# Altium schematic sheet Peripherals-Sheet-1.SchDoc (part 1 of 3)
size 420 x 297 mm; SheetNumber: 9; SheetTotal: 12
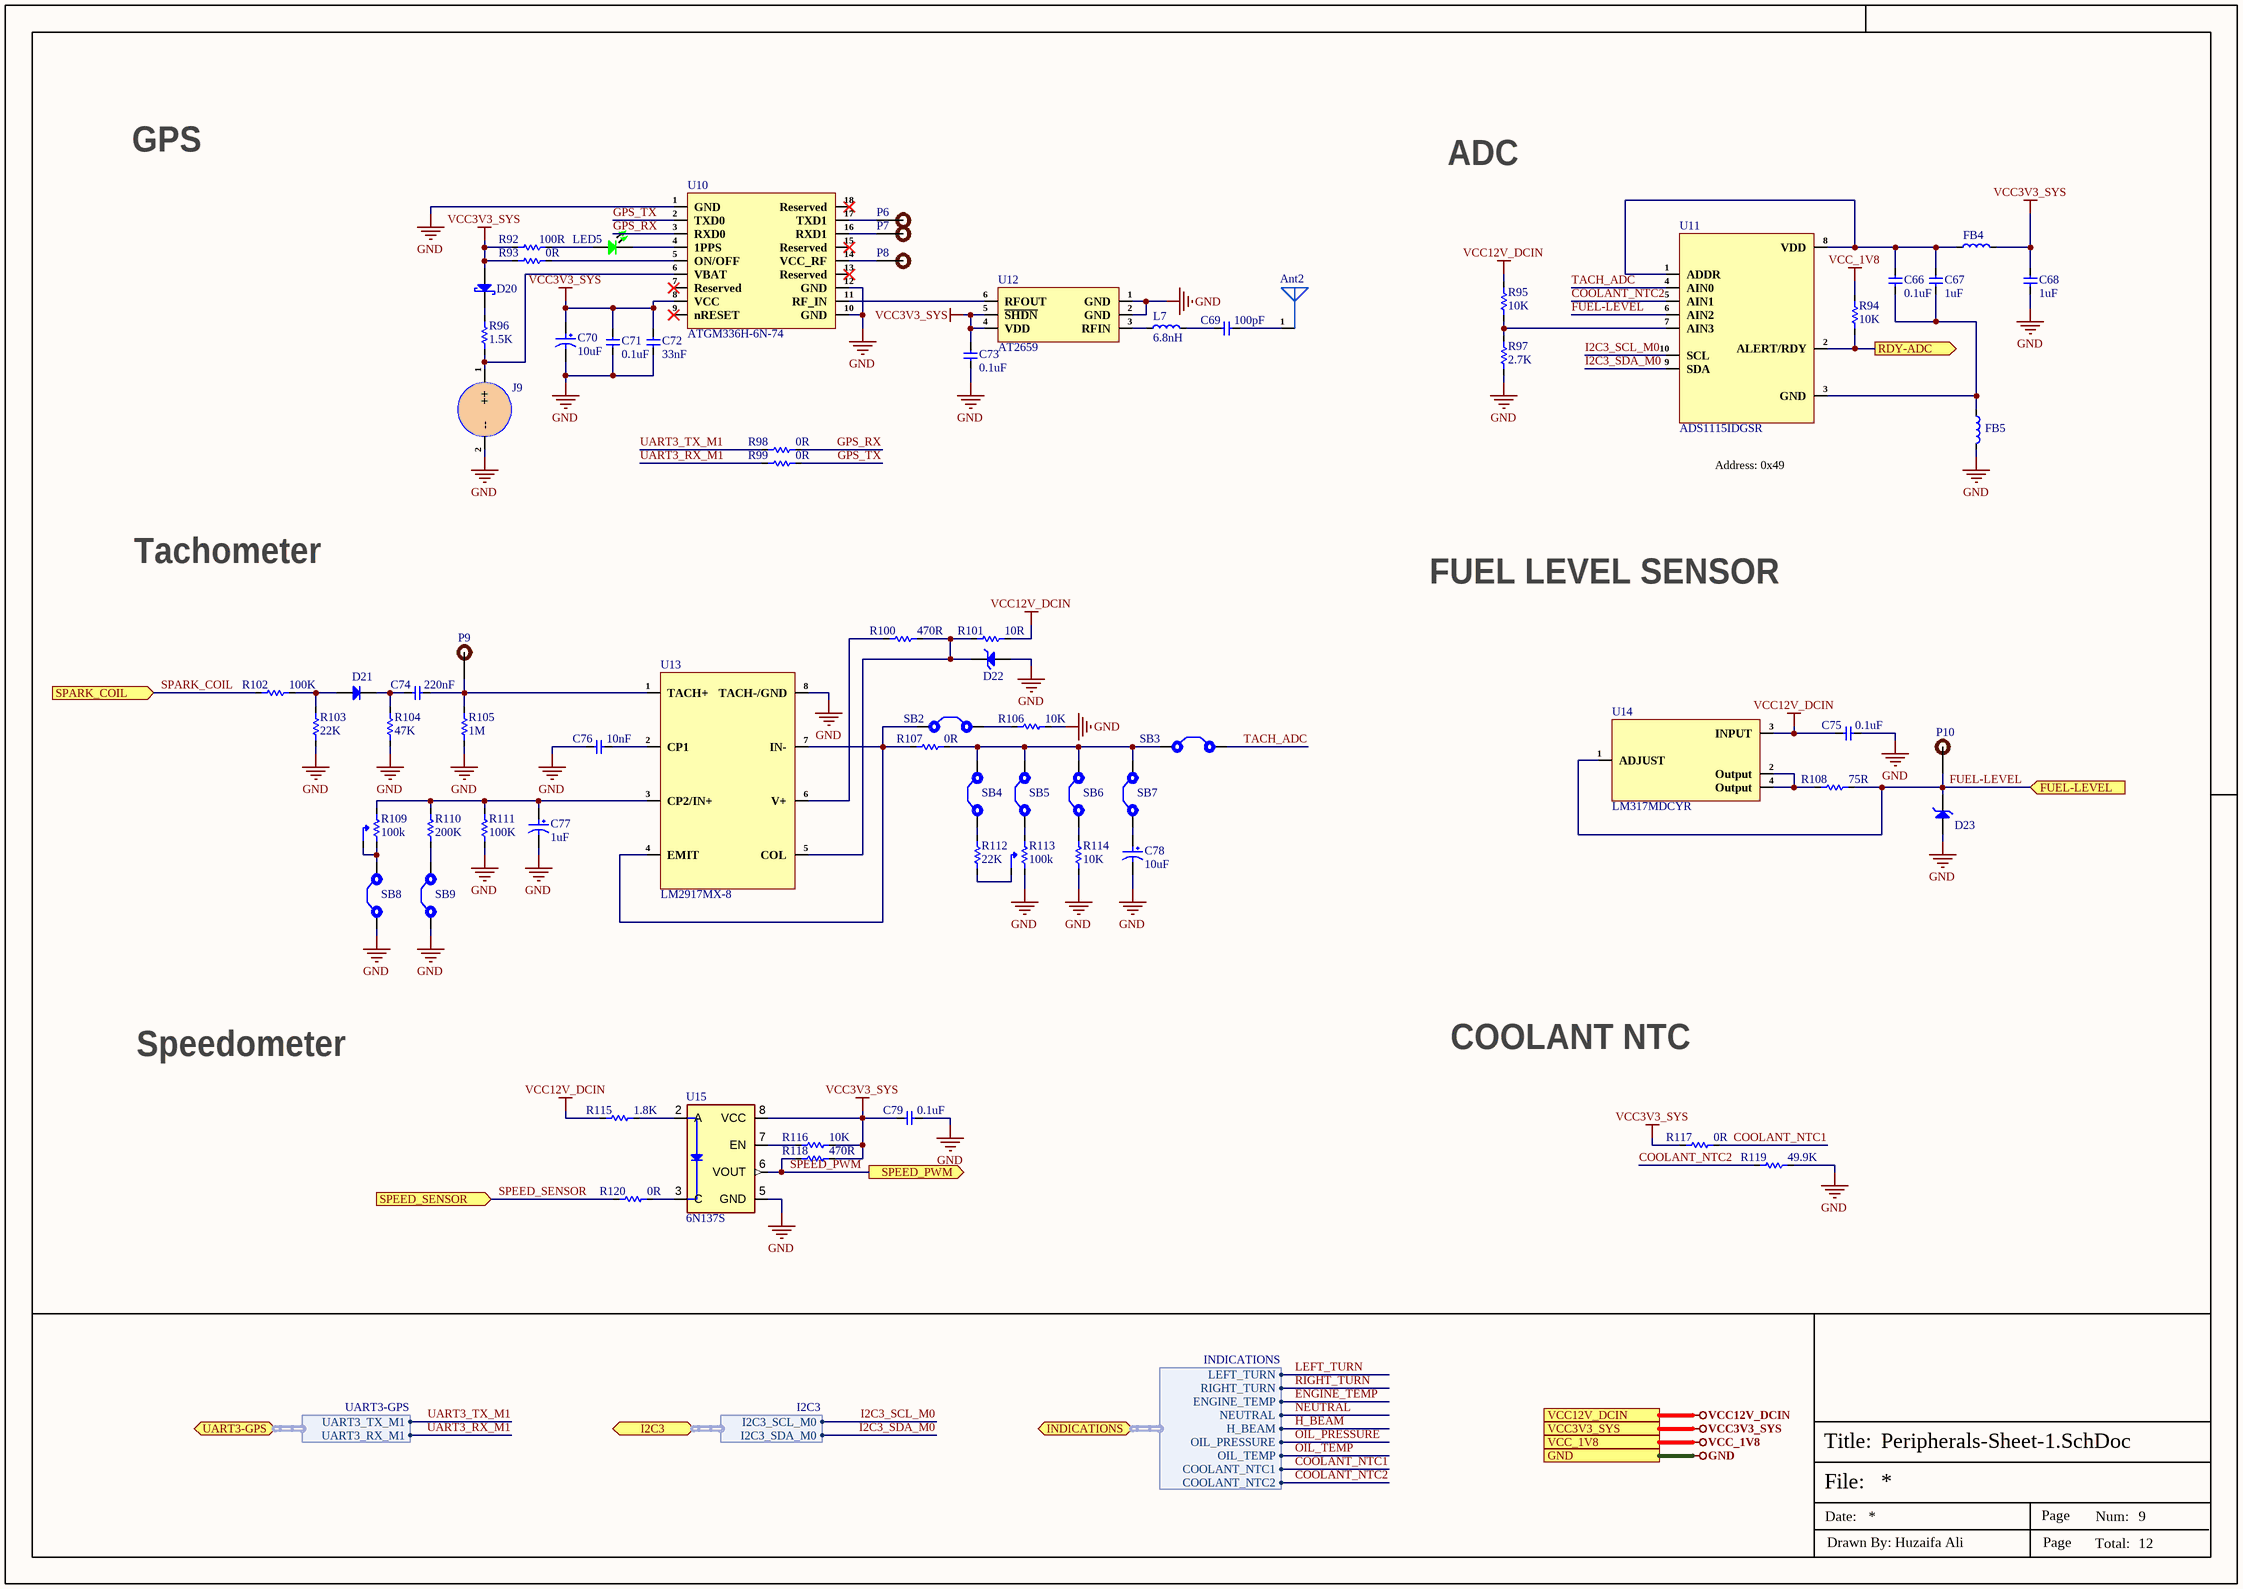
[diagram p0: Peripherals-Sheet-1.SchDoc]

## Parts
Ant2  KH-GPS181804-WY  [KH-GPS181804-WY]  (value not drawn)
C66  0.1uF  [Cap-0402]
C67  1uF  [Cap-0402]
C68  1uF  [Cap-0402]
C69  100pF  [Cap-0603]
C70  10uF  [RVT1E100M0405_]
C71  0.1uF  [Cap-0402]
C72  33nF  [Cap-0402]
C73  0.1uF  [Cap-0402]
C74  220nF  [Cap-1210]
C75  0.1uF  [Cap-0402]
C76  10nF  [Cap-0805]
C77  1uF  [RVT1H1R0M0405]
C78  10uF  [50SVPF10M]
C79  0.1uF  [Cap-0402]
D20  B5819WS  [SOD-323]  (value not drawn)
D21  1N4007- SMD  [SMA(DO-214AC)]  (value not drawn)
D22  BZT52C16  [SOD-123]  (value not drawn)
D23  MSP3V3HM3/89A  [MicroSMP]  (value not drawn)
FB4  MMZ2012R102ATD25  [Ind-0805]  (value not drawn)
FB5  MMZ2012R102ATD25  [Ind-0805]  (value not drawn)
J9  PB-621SR13-TF  [PB-621SR13-TF]  (value not drawn)
L7  6.8nH  [Ind-0805]
LED5  Emerald  [LED-0603]  (value not drawn)
P6  TEST POINT 0.5mm Dia  [Test-point - 0.5mm]  (value not drawn)  (no BOM)
P7  TEST POINT 0.5mm Dia  [Test-point - 0.5mm]  (value not drawn)  (no BOM)
P8  TEST POINT 0.5mm Dia  [Test-point - 0.5mm]  (value not drawn)  (no BOM)
P9  TEST POINT 0.5mm Dia  [Test-point - 0.5mm]  (value not drawn)  (no BOM)
P10  TEST POINT 0.5mm Dia  [Test-point - 0.5mm]  (value not drawn)  (no BOM)
R92  100R  [Res-0402]
R93  0R  [Res-0402]
R94  10K  [Res-0402]
R95  10K  [Res-0603]
R96  1.5K  [Res-0402]
R97  2.7K  [Res-0603]
R98  0R  [Res-0402]
R99  0R  [Res-0402]
R100  470R  [Res-0603]
R101  10R  [Res-0603]
R102  100K  [RES-0805]
R103  22K  [Res-0603]
R104  47K  [Res-0603]
R105  1M  [RES-0805]
R106  10K  [Res-0402]
R107  0R  [Res-0805]
R108  75R  [Res-0603]
R109  100k  [TC33X-2-104E_]
R110  200K  [Res-0402]
R111  100K  [Res-0402]
R112  22K  [Res-0603]
R113  100k  [TC33X-2-104E_]
R114  10K  [Res-0402]
R115  1.8K  [Res-0402]
R116  10K  [Res-0402]
R117  0R  [Res-0402]
R118  470R  [Res-0402]
R119  49.9K  [Res-0402]
R120  0R  [Res-0402]
SB2  Solder Bridge 0603  [Solder Bridge]  (value not drawn)  (no BOM)
SB3  Solder Bridge 0603  [Solder Bridge]  (value not drawn)  (no BOM)
SB4  Solder Bridge 0603  [Solder Bridge]  (value not drawn)  (no BOM)
SB5  Solder Bridge 0603  [Solder Bridge]  (value not drawn)  (no BOM)
SB6  Solder Bridge 0603  [Solder Bridge]  (value not drawn)  (no BOM)
SB7  Solder Bridge 0603  [Solder Bridge]  (value not drawn)  (no BOM)
SB8  Solder Bridge 0603  [Solder Bridge]  (value not drawn)  (no BOM)
SB9  Solder Bridge 0603  [Solder Bridge]  (value not drawn)  (no BOM)
U10  ATGM336H-6N-74  [ATGM336H-6N-74]
U11  ADS1115IDGSR  [VSSOP-10]
U12  AT2659  [DFN-6(1x1.6)]
U13  LM2917MX-8  [SOIC-8(0.154", 3.90mm Width)]
U14  LM317MDCYR  [SOT- 223]
U15  6N137S  [8-SMD]

## Ports
FUEL-LEVEL (in, see Top-Sheet[4B]), GND (see Top-Sheet[6B]), I2C3 (bidir, harness I2C3, see Top-Sheet[4B]), INDICATIONS (bidir, harness INDICATIONS, see Top-Sheet[4B]), RDY-ADC (out, see Top-Sheet[4B]), SPARK_COIL (in, see Top-Sheet[4B]), SPEED_PWM (out, see Top-Sheet[4B]), SPEED_SENSOR (in, see Top-Sheet[4B]), UART3-GPS (bidir, harness UART3-GPS, see Top-Sheet[4B]), VCC3V3_SYS (see Top-Sheet[6B]), VCC12V_DCIN (see Top-Sheet[6B]), VCC_1V8 (see Top-Sheet[6B])

## Harnesses
UART3-GPS: UART3_TX_M1, UART3_RX_M1
I2C3: I2C3_SCL_M0, I2C3_SDA_M0
INDICATIONS: LEFT_TURN, RIGHT_TURN, ENGINE_TEMP, NEUTRAL, H_BEAM, OIL_PRESSURE, OIL_TEMP, COOLANT_NTC1, COOLANT_NTC2

## Nets
GND: C68.2 C70.2 C71.1 C72.1 C73.1 C75.1 C76.1 C77.2 C78.2 C79.2 D22.1(A) D23.1(A) FB5.2 J9.2(--) R97.1 R103.1 R104.1 R105.1 R106.2 R111.1 R113.1(CCW) R114.1 R119.2 SB8.1 SB9.1 U10.1(GND) U10.10(GND) U10.12(GND) U12.1(GND) U12.2(GND) U13.8(TACH-/GND) U15.5(GND) ; port GND
VCC3V3_SYS: C68.1 C70.1 C71.2 C72.2 C73.2 C79.1 D20.2(A) FB4.2 R92.1 R93.1 R116.2 R117.1 R118.2 U10.8(VCC) U12.4(VDD) U12.5(~{SH}~{DN}) U15.8(VCC) ; port VCC3V3_SYS
VCC12V_DCIN: C75.2 R95.2 R101.2 R115.1 U14.3(INPUT) ; port VCC12V_DCIN
VCC_1V8: R94.2 ; port VCC_1V8
COOLANT_NTC1: R117.2 ; port INDICATIONS.COOLANT_NTC1
COOLANT_NTC2: R119.1 U11.5(AIN1) ; port INDICATIONS.COOLANT_NTC2
ENGINE_TEMP: port INDICATIONS.ENGINE_TEMP
FUEL-LEVEL: D23.2(K) P10.1 R108.2 U11.6(AIN2) U14.1(ADJUST) ; port FUEL-LEVEL
GPS_RX: R98.2 U10.3(RXD0)
GPS_TX: R99.2 U10.2(TXD0)
H_BEAM: port INDICATIONS.H_BEAM
I2C3_SCL_M0: U11.10(SCL) ; port I2C3.I2C3_SCL_M0
I2C3_SDA_M0: U11.9(SDA) ; port I2C3.I2C3_SDA_M0
LEFT_TURN: port INDICATIONS.LEFT_TURN
NEUTRAL: port INDICATIONS.NEUTRAL
OIL_PRESSURE: port INDICATIONS.OIL_PRESSURE
OIL_TEMP: port INDICATIONS.OIL_TEMP
RDY-ADC: R94.1 U11.2(ALERT/RDY) ; port RDY-ADC
RIGHT_TURN: port INDICATIONS.RIGHT_TURN
SPARK_COIL: R102.1 ; port SPARK_COIL
SPEED_PWM: R118.1 U15.6(VOUT) ; port SPEED_PWM
SPEED_SENSOR: R120.1 ; port SPEED_SENSOR
TACH_ADC: SB3.2 U11.4(AIN0)
UART3_RX_M1: R99.1 ; port UART3-GPS.UART3_RX_M1
UART3_TX_M1: R98.1 ; port UART3-GPS.UART3_TX_M1
NetAnt2_1: Ant2.1 C69.2
NetC66_1: C66.1 C67.1 FB4.1 U11.1(ADDR) U11.8(VDD)
NetC66_2: C66.2 C67.2 FB5.1 U11.3(GND)
NetC69_1: C69.1 L7.2
NetC74_1: C74.1 P9.1 R105.2 U13.1(TACH+)
NetC74_2: C74.2 D21.1(K) R104.2
NetC76_2: C76.2 U13.2(CP1)
NetC77_1: C77.1 R109.3(CW) R110.2 R111.2 U13.3(CP2/IN+)
NetC78_1: C78.1 SB7.1
NetD20_1: D20.1(K) R96.2
NetD21_2: D21.2(A) R102.2 R103.2
NetD22_2: D22.2(K) R100.2 R101.1 U13.5(COL)
NetJ9_1: J9.1(++) R96.1 U10.6(VBAT)
NetL7_1: L7.1 U12.3(RFIN)
NetLED5_1: LED5.1 R92.2
NetLED5_2: LED5.2 U10.4(1PPS)
NetP6_1: P6.1 U10.17(TXD1)
NetP7_1: P7.1 U10.16(RXD1)
NetP8_1: P8.1 U10.14(VCC_RF)
NetR93_2: R93.2 U10.5(ON/OFF)
NetR95_1: R95.1 R97.2 U11.7(AIN3)
NetR100_1: R100.1 U13.6(V+)
NetR106_1: R106.1 SB2.2
NetR107_1: R107.1 SB2.1 U13.4(EMIT) U13.7(IN-)
NetR107_2: R107.2 SB3.1 SB4.2 SB5.2 SB6.2 SB7.2
NetR108_1: R108.1 U14.2(Output) U14.4(Output)
NetR109_1: R109.1(CCW) R109.2(Wiper) SB8.2
NetR110_1: R110.1 SB9.2
NetR112_1: R112.1 R113.2(Wiper)
NetR112_2: R112.2 SB4.1
NetR113_3: R113.3(CW) SB5.1
NetR114_2: R114.2 SB6.1
NetR115_2: R115.2 U15.2(A)
NetR116_1: R116.1 U15.7(EN)
NetR120_2: R120.2 U15.3(C)
NetU10_11: U10.11(RF_IN) U12.6(RFOUT)

Not connected (* = marked no-connect by the designer): U10 7(Reserved)* 9(nRESET)* 13(Reserved)* 15(Reserved)* 18(Reserved)*

## Notes on the sheet
- GPS
- ADC
- Address: 0x49
- Tachometer
- FUEL LEVEL SENSOR
- Speedometer
- COOLANT NTC
- File:
- Title:
- Date:
- Page
- Num:
- Total:
- Drawn By: Huzaifa Ali